# EasyEDA Pro project dev_box1.eprj

# Schematic Schematic1
Board Name: main; Create Date: 2026-04-28; Page Name: P1; Project Name: dev box1; Schematic Name: Schematic1; Update Date: 2026-06-05; Company: EasyEDA.com; Page Size: A4; Version: V1.0
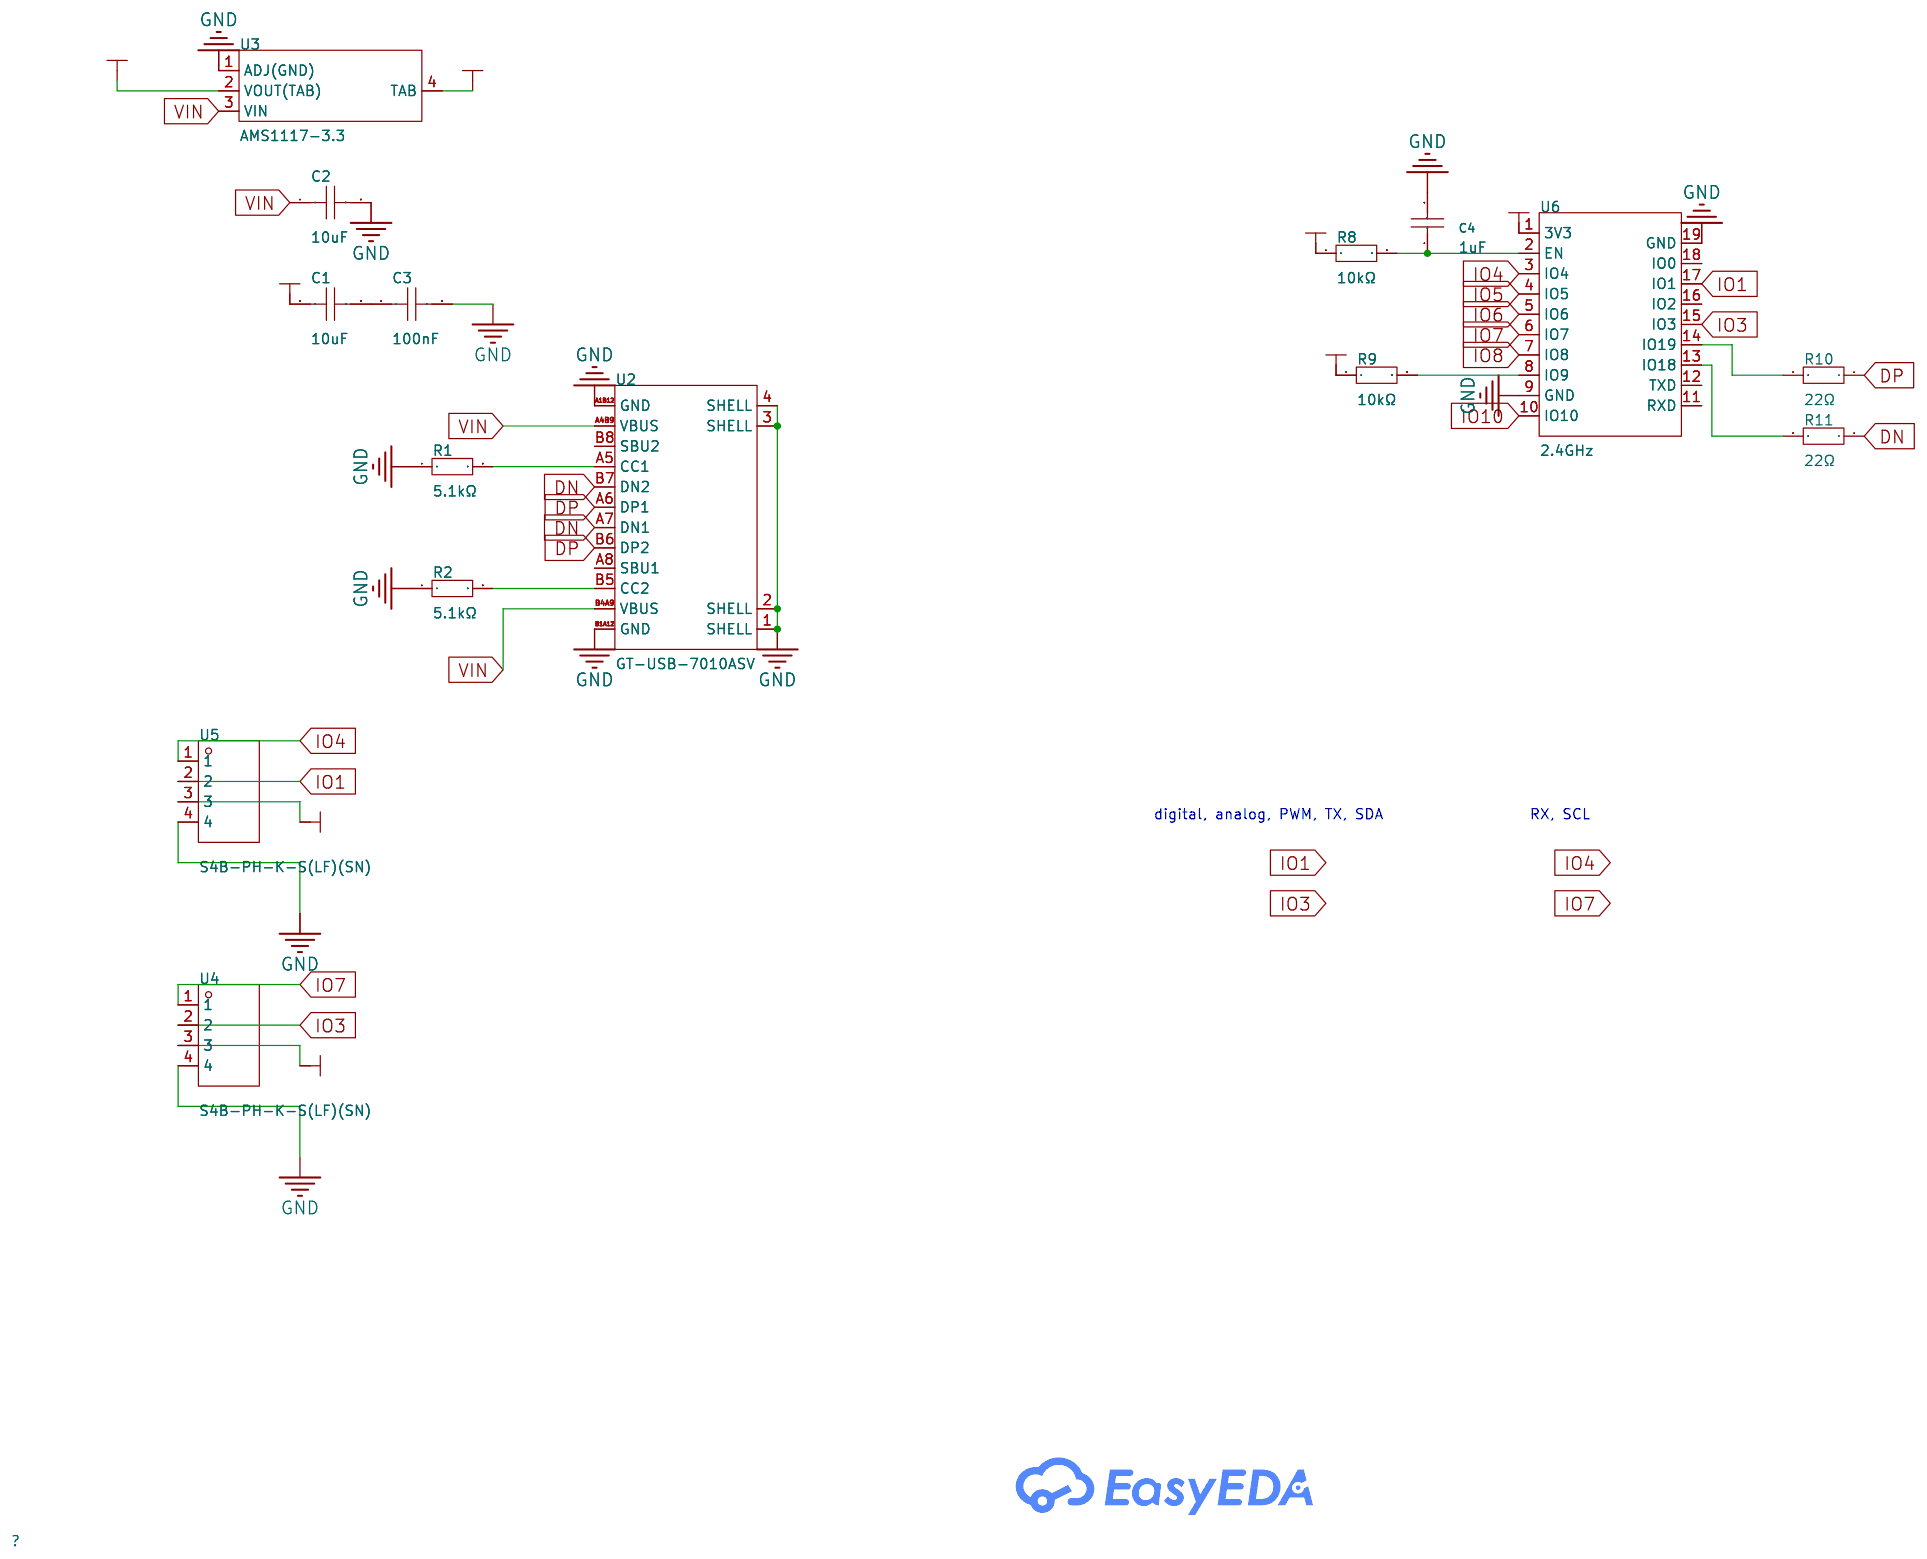
[diagram p0: schematic sheet]

## Parts
C1  10uF  [C0603]
C2  10uF  [C0603]
C3  100nF  [C0603]
C4  1uF  [C0603]
R1  5.1kΩ  [R0603]
R2  5.1kΩ  [R0603]
R8  10kΩ  [R0603]
R9  10kΩ  [R0603]
R10  22Ω  [R0603]
R11  22Ω  [R0603]
U2  GT-USB-7010ASV  [USB-C-SMD_G-SWITCH_GT-USB-7010ASV]
U3  AMS1117-3.3  [SOT-223-4_L6.5-W3.5-P2.30-LS7.0-BR]
U4  S4B-PH-K-S(LF)(SN)  [CONN-TH_4P-P2.00_S4B-PH-K-S-LF-SN]
U5  S4B-PH-K-S(LF)(SN)  [CONN-TH_4P-P2.00_S4B-PH-K-S-LF-SN]
U6  2.4GHz  [WIFIM-SMD_18P-L20.0-W18.0-P1.50]

## Library data of the parts
C1 C2 = CC0603MRX5R8BB106: LCSC Part Name: 10uF ±20% 25V; Supplier Part: C596327; Manufacturer: YAGEO(国巨); Supplier Footprint: 0603; JLCPCB Part Class: Extended Part; Datasheet: https://item.szlcsc.com/datasheet/CC0603MRX5R8BB106/624311.html; Supplier: LCSC; Tolerance: ±20%; Voltage Rating: 25V; Temperature Coefficient: X5R
C3 = CC0603KRX7R9BB104: LCSC Part Name: 100nF ±10% 50V; Supplier Part: C14663; Manufacturer: YAGEO(国巨); Supplier Footprint: 0603; JLCPCB Part Class: Basic Part; Datasheet: https://item.szlcsc.com/datasheet/CC0603KRX7R9BB104/15331.html; Supplier: LCSC; Tolerance: ±10%; Voltage Rating: 50V; Temperature Coefficient: X7R
C4 = CC0603KRX7R7BB105: LCSC Part Name: 1uF ±10% 16V; Supplier Part: C106248; Manufacturer: YAGEO(国巨); Supplier Footprint: 0603; JLCPCB Part Class: Extended Part; Datasheet: https://item.szlcsc.com/datasheet/CC0603KRX7R7BB105/107463.html; Supplier: LCSC; Tolerance: ±10%; Voltage Rating: 16V; Temperature Coefficient: X7R
R1 R2 = RT0603BRD075K1L: LCSC Part Name: 薄膜电阻 5.1kΩ ±0.1% 100mW; Supplier Part: C122969; Manufacturer: YAGEO(国巨); Supplier Footprint: 0603; JLCPCB Part Class: Extended Part; Datasheet: https://atta.szlcsc.com/upload/public/pdf/source/20170728/C122969_1501225761505848820.pdf; Supplier: LCSC; Type: Thin Film Resistor; Tolerance: ±0.1%; Temperature Coefficient: ±25ppm/℃; Operating Temperature Range: -55℃~+155℃
R8 R9 = RC0603FR-0710KL: LCSC Part Name: 厚膜电阻 10kΩ ±1% 100mW; Supplier Part: C98220; Manufacturer: YAGEO(国巨); Supplier Footprint: 0603; JLCPCB Part Class: Extended Part; Datasheet: https://atta.szlcsc.com/upload/public/pdf/source/20180927/C295883_E8D83085EA81BD7DE0B2B681138C15EE.pdf; Supplier: LCSC; Type: Thick Film Resistors; Tolerance: ±1%; Temperature Coefficient: ±100ppm/℃; Operating Temperature Range: -55℃~+155℃
R10 R11 = RC0603FR-0722RL: LCSC Part Name: 厚膜电阻 22Ω ±1% 100mW; Supplier Part: C107701; Manufacturer: YAGEO(国巨); Supplier Footprint: 0603; JLCPCB Part Class: Extended Part; Datasheet: https://atta.szlcsc.com/upload/public/pdf/source/20170914/C127450_1505359406912967677.pdf; Supplier: LCSC; Type: Thick Film Resistors; Tolerance: ±1%; Temperature Coefficient: ±100ppm/℃; Operating Temperature Range: -55℃~+155℃
U2 = GT-USB-7010ASV: LCSC Part Name: Type-C 母 卧贴; Supplier Part: C2988369; Manufacturer: G-Switch(品赞); Supplier Footprint: SMD; JLCPCB Part Class: Extended Part; Datasheet: https://item.szlcsc.com/datasheet/GT-USB-7010ASV/3445595.html; Supplier: LCSC; Connector Type: Type-C; Protocol Standard: USB 2.0; Gender: Female; Mounting Type: Surface Mount, Right Angle; Number of Contacts: 16P; Number of Ports: 1; Current Rating-Power: 3A; Voltage Rating: 24V; Connect-Disconnect Life: 10,000 cycles; Center Height: 1.68mm; Length: 7.35mm; Detection color: Black; Operating Temperature: -40℃~+85℃
U3 = AMS1117-3.3_C347222: LCSC Part Name: 3.3V 1A 12V; Supplier Part: C347222; Manufacturer: UMW(友台半导体); Supplier Footprint: SOT-223; JLCPCB Part Class: Extended Part; Datasheet: https://item.szlcsc.com/datasheet/AMS1117-3.3/323882.html; Supplier: LCSC; Output Type: Fixed; Voltage - Supply: 12V; Output Voltage: 3.3V; Output Current: 1A; Power Supply Rejection Ratio (PSRR): 60dB@(120Hz); Voltage Dropout: 1.3V@(1A); standby current: 5mA; Noise: 0.003%Vout; Features: Over Current Protection; Operating Temperature: -40℃~+125℃; Output Configuration: Positive; Number of Outputs: 1
U4 U5 = S4B-PH-K-S(LF)(SN): LCSC Part Name: 1x4P 间距:2mm 弯插 系列:PH; Supplier Part: C157926; Manufacturer: JST; Supplier Footprint: 弯插,P=2mm; JLCPCB Part Class: Extended Part; Datasheet: https://item.szlcsc.com/datasheet/S4B-PH-K-S(LF)(SN)/169274.html; Supplier: LCSC; Pins Structure: 1x4P; Pitch: 2mm; Mounting Type: Right Angle; Reference Series: PH; Number of Pins: 4P; Number of Rows: 1; Number of PINs Per Row: 4; Current Rating: 2A; Contact Material: Brass; Contact Plating: Tin; Operating Temperature: -25℃~+85℃; Voltage Rating: 100V; Plastic Material: PA66; Flame Retardant Rating: UL94V-0; Supplementary Features: K Pin; Color: White; Z-Height of the Board: 4.8mm; X-Length of Bottom Edge on Board (Spacing Line): 9.9mm; Y-Width of Bottom Edge on Board: 7.6mm
U6 = ESP32-C3-WROOM-02-H4: LCSC Part Name: 不带固件 2.4GHz Wi-Fi（802.11b/g/n）+ 蓝牙5模组; Supplier Part: C2944070; Manufacturer: ESPRESSIF(乐鑫); Supplier Footprint: SMD,20x18mm; JLCPCB Part Class: Extended Part; Datasheet: https://item.szlcsc.com/datasheet/ESP32-C3-WROOM-02-H4/3329762.html; Supplier: LCSC; Utilized IC / Part: ESP32-C3; Wireless Standard: Bluetooth5.0; Interface Type: I2C；UART；SPI；USB；I2S; Antenna Type: On-board PCB Antenna; Output Power: 20.5dBm; Voltage - Supply: 3V~3.6V; Receive  Current: 82mA; Send  Current: 345mA; Sensitivity: -105dBm; Operating Temperature: -40℃~+105℃

## Nets
3.3V: C1.1 R8.1 R9.1 U3.2(VOUT(TAB)) U3.4(TAB) U4.3 U5.3 U6.1(3V3)
GND: C2.2 C3.2 C4.2 R1.1 R2.1 U2.1(SHELL) U2.2(SHELL) U2.3(SHELL) U2.4(SHELL) U2.A1B12(GND) U2.B1A12(GND) U3.1(ADJ(GND)) U4.4 U5.4 U6.9(GND) U6.19(GND)
VIN: C2.1 U2.A4B9(VBUS) U2.B4A9(VBUS) U3.3(VIN)
DN: R11.1 U2.A7(DN1) U2.B7(DN2)
DP: R10.1 U2.A6(DP1) U2.B6(DP2)
IO1: U5.2 U6.17(IO1)
IO3: U4.2 U6.15(IO3)
IO4: U5.1 U6.3(IO4)
IO5: U6.4(IO5)
IO6: U6.5(IO6)
IO7: U4.1 U6.6(IO7)
IO8: U6.7(IO8)
IO10: U6.10(IO10)
$1N2133: R1.2 U2.A5(CC1)
$1N2135: R2.2 U2.B5(CC2)
$1N2463: C1.2 C3.1
$1N6447: R10.2 U6.14(IO19)
$1N6453: R11.2 U6.13(IO18)
$1N6705: C4.1 R8.2 U6.2(EN)
$1N6831: R9.2 U6.8(IO9)

Not connected (* = marked no-connect by the designer): U2 A8(SBU1) B8(SBU2); U6 11(RXD) 12(TXD) 16(IO2) 18(IO0)

## Notes on the sheet
- digital, analog, PWM, TX, SDA
- RX, SCL

# Schematic Schematic2
Board Name: temp&hum; Create Date: 2026-04-29; Page Name: P1; Project Name: dev box1; Schematic Name: Schematic2; Update Date: 2026-04-29; Company: EasyEDA.com; Page Size: A4; Version: V1.0
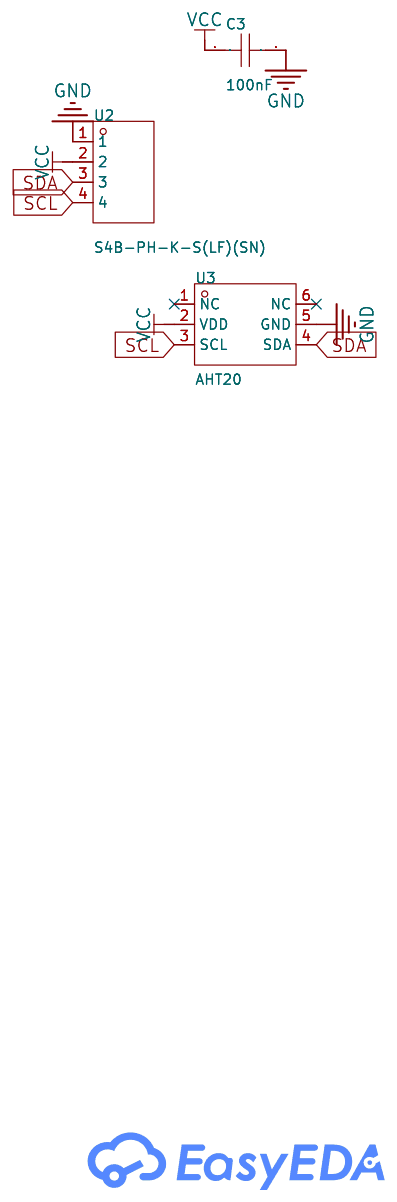
[diagram p1: schematic sheet]

## Parts
C3  100nF  [C0603]
U2  S4B-PH-K-S(LF)(SN)  [CONN-TH_4P-P2.00_S4B-PH-K-S-LF-SN]
U3  AHT20  [SENSOR-SMD_L3.0-W3.0-P1.00-BR]

## Library data of the parts
C3 = CC0603KRX7R9BB104: LCSC Part Name: 100nF ±10% 50V; Supplier Part: C14663; Manufacturer: YAGEO(国巨); Supplier Footprint: 0603; JLCPCB Part Class: Basic Part; Datasheet: https://item.szlcsc.com/datasheet/CC0603KRX7R9BB104/15331.html; Supplier: LCSC; Tolerance: ±10%; Voltage Rating: 50V; Temperature Coefficient: X7R
U2 = S4B-PH-K-S(LF)(SN): LCSC Part Name: 1x4P 间距:2mm 弯插 系列:PH; Supplier Part: C157926; Manufacturer: JST; Supplier Footprint: 弯插,P=2mm; JLCPCB Part Class: Extended Part; Datasheet: https://item.szlcsc.com/datasheet/S4B-PH-K-S(LF)(SN)/169274.html; Supplier: LCSC; Pins Structure: 1x4P; Pitch: 2mm; Mounting Type: Right Angle; Reference Series: PH; Number of Pins: 4P; Number of Rows: 1; Number of PINs Per Row: 4; Current Rating: 2A; Contact Material: Brass; Contact Plating: Tin; Operating Temperature: -25℃~+85℃; Voltage Rating: 100V; Plastic Material: PA66; Flame Retardant Rating: UL94V-0; Supplementary Features: K Pin; Color: White; Z-Height of the Board: 4.8mm; X-Length of Bottom Edge on Board (Spacing Line): 9.9mm; Y-Width of Bottom Edge on Board: 7.6mm
U3 = AHT20: LCSC Part Name: 温湿度传感器，完全标定，数字输出，IC接口; Supplier Part: C2757850; Manufacturer: 广州奥松; Supplier Footprint: SMD; JLCPCB Part Class: Extended Part; Datasheet: https://item.szlcsc.com/datasheet/AHT20/2874650.html; Supplier: LCSC; Temperature Range: -40℃~+120℃; Humidity: 0%RH~100%RH; Interface: I2C; Voltage - Supply: 2.2V~5.5V; Current - Supply: 570uA; Humidity Tolerance: ±2%RH; Temperature Tolerance: ±0.3℃; Resolution: 20bit

## Nets
GND: C3.2 U2.1 U3.5(GND)
VCC: C3.1 U2.2 U3.2(VDD)
SCL: U2.4 U3.3(SCL)
SDA: U2.3 U3.4(SDA)

Not connected (* = marked no-connect by the designer): U3 1(NC)* 6(NC)*

# Schematic Schematic2_1
Board Name: LED; Create Date: 2026-05-23; Page Name: P1; Project Name: dev box1; Schematic Name: Schematic2_1; Update Date: 2026-05-23; Company: EasyEDA.com; Page Size: A4; Version: V1.0
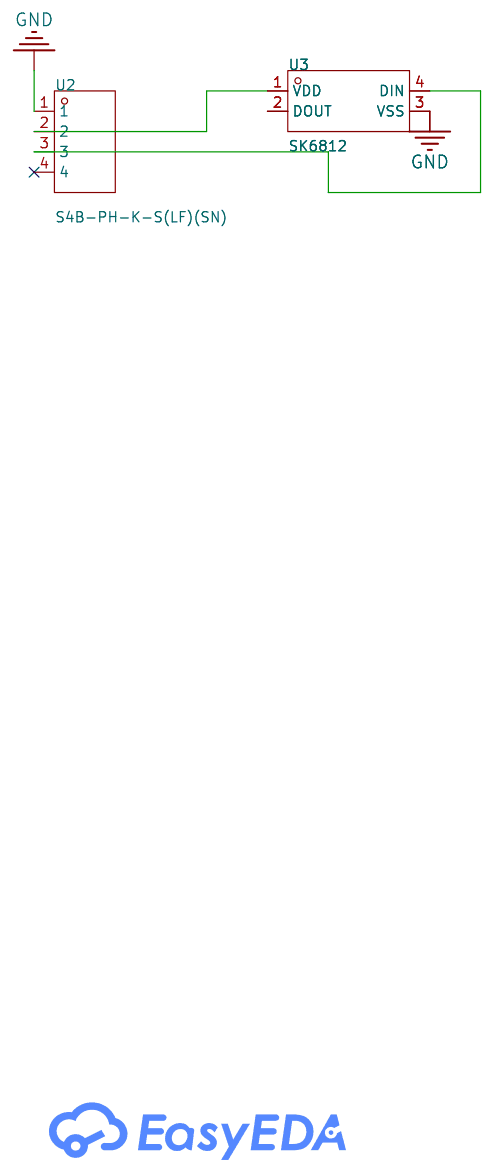
[diagram p2: schematic sheet]

## Parts
U2  S4B-PH-K-S(LF)(SN)  [CONN-TH_4P-P2.00_S4B-PH-K-S-LF-SN]
U3  SK6812  [LED-SMD_4P-L5.0-W5.0-TL]

## Library data of the parts
U2 = S4B-PH-K-S(LF)(SN): LCSC Part Name: 1x4P 间距:2mm 弯插 系列:PH; Supplier Part: C157926; Manufacturer: JST; Supplier Footprint: 弯插,P=2mm; JLCPCB Part Class: Extended Part; Datasheet: https://item.szlcsc.com/datasheet/S4B-PH-K-S(LF)(SN)/169274.html; Supplier: LCSC; Pins Structure: 1x4P; Pitch: 2mm; Mounting Type: Right Angle; Reference Series: PH; Number of Pins: 4P; Number of Rows: 1; Number of PINs Per Row: 4; Current Rating: 2A; Contact Material: Brass; Contact Plating: Tin; Operating Temperature: -25℃~+85℃; Voltage Rating: 100V; Plastic Material: PA66; Flame Retardant Rating: UL94V-0; Supplementary Features: K Pin; Color: White; Z-Height of the Board: 4.8mm; X-Length of Bottom Edge on Board (Spacing Line): 9.9mm; Y-Width of Bottom Edge on Board: 7.6mm
U3 = SK6812: Supplier Part: C2765348; Supplier Footprint: SMD-4P,2.0x4; Supplier: LCSC

## Nets
GND: U2.1 U3.3(VSS)
$1N1284: U2.2 U3.1(VDD)
$1N1293: U2.3 U3.4(DIN)

Not connected (* = marked no-connect by the designer): U2 4*; U3 2(DOUT)

# Schematic Schematic2_2
Board Name: BUZZER; Create Date: 2026-05-23; Page Name: P1; Project Name: dev box1; Schematic Name: Schematic2_2; Update Date: 2026-05-23; Company: EasyEDA.com; Page Size: A4; Version: V1.0
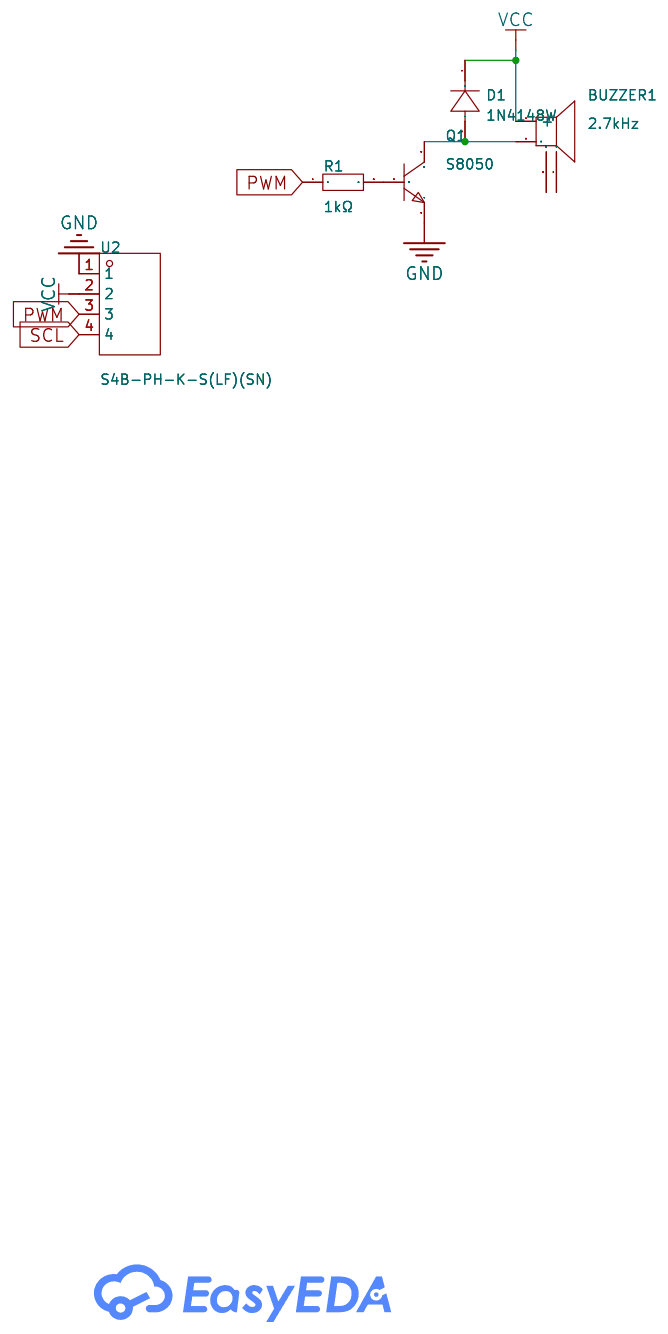
[diagram p3: schematic sheet]

## Parts
BUZZER1  2.7kHz  [BUZ-SMD_4P-L8.5-W8.5-P8.50-BR]
D1  1N4148W  [SOD-123_L2.8-W1.8-LS3.7-RD-1]
Q1  S8050  [SOT-23-3_L2.9-W1.3-P1.90-LS2.4-BR]
R1  1kΩ  [R0603]
U2  S4B-PH-K-S(LF)(SN)  [CONN-TH_4P-P2.00_S4B-PH-K-S-LF-SN]

## Library data of the parts
BUZZER1 = MLT-8530: LCSC Part Name: 无源(外部驱动) 电磁式 2.7kHz; Supplier Part: C94599; Manufacturer: 华能; Supplier Footprint: SMD,8.5x8.5mm; JLCPCB Part Class: Extended Part; Datasheet: https://item.szlcsc.com/datasheet/MLT-8530/95797.html; Supplier: LCSC; Driver Circuitry: Passive (Externally Driven); Technology: Electromagnetic; Voltage Rating: 3.6V; Voltage - Supply: 2.5V~4.5V; Current Consumption: 95mA; Sound Pressure Level(SPL): 80dB; Length: 8.5mm; Width: 8.5mm; Height: 3.3mm; Operating Temperature: -20℃~+70℃; Mounting Type: SMD
D1 = 1N4148W_C917030: Supplier Part: C917030; Manufacturer: JSMSEMI(杰盛微); Supplier Footprint: SOD-123; JLCPCB Part Class: Extended Part; Datasheet: https://item.szlcsc.com/datasheet/1N4148W/991526.html; Supplier: LCSC; Diode Configuration: Independent; Voltage - Forward(Vf@If): 1.25V@150mA; Voltage - DC Reverse(Vr): 100V; Current - Rectified: 300mA; Pd - Power Dissipation: 400mW; Reverse Leakage Current (Ir): 1uA@75V; Reverse Recovery Time (trr): 8ns; Operating Junction Temperature Range: -55℃~+150℃@(Tj); Non-Repetitive Peak Forward Surge Current: 4A
Q1 = S8050_C916390: LCSC Part Name: 电流:500mA 电压:25V; Supplier Part: C916390; Manufacturer: JSMSEMI(杰盛微); Supplier Footprint: SOT-23; JLCPCB Part Class: Extended Part; Datasheet: https://item.szlcsc.com/datasheet/S8050/990886.html; Supplier: LCSC; Current - Collector(Ic): 500mA; Collector - Emitter Voltage VCEO: 25V; Pd - Power Dissipation: 300mW; Transition frequency(fT): 150MHz; Current - Collector Cutoff: 100nA; Vce Saturation(VCE(sat)): 600mV; Emitter-Base Voltage(Vebo): 5V; Number: 1 NPN; Configuration: Independent
R1 = RC0603FR-071KL: LCSC Part Name: 厚膜电阻 1kΩ ±1% 100mW; Supplier Part: C22548; Manufacturer: YAGEO(国巨); Supplier Footprint: 0603; JLCPCB Part Class: Extended Part; Datasheet: https://item.szlcsc.com/datasheet/RC0603FR-071KL/23274.html; Supplier: LCSC; Type: Thick Film Resistor; Tolerance: ±1%; Power(Watts): 100mW; Voltage-Supply(Max): 75V; Temperature Coefficient: ±100ppm/℃; Operating Temperature: -55℃~+155℃
U2 = S4B-PH-K-S(LF)(SN): LCSC Part Name: 1x4P 间距:2mm 弯插 系列:PH; Supplier Part: C157926; Manufacturer: JST; Supplier Footprint: 弯插,P=2mm; JLCPCB Part Class: Extended Part; Datasheet: https://item.szlcsc.com/datasheet/S4B-PH-K-S(LF)(SN)/169274.html; Supplier: LCSC; Pins Structure: 1x4P; Pitch: 2mm; Mounting Type: Right Angle; Reference Series: PH; Number of Pins: 4P; Number of Rows: 1; Number of PINs Per Row: 4; Current Rating: 2A; Contact Material: Brass; Contact Plating: Tin; Operating Temperature: -25℃~+85℃; Voltage Rating: 100V; Plastic Material: PA66; Flame Retardant Rating: UL94V-0; Supplementary Features: K Pin; Color: White; Z-Height of the Board: 4.8mm; X-Length of Bottom Edge on Board (Spacing Line): 9.9mm; Y-Width of Bottom Edge on Board: 7.6mm

## Nets
GND: Q1.2(E) U2.1
VCC: BUZZER1.1(+) D1.1(C) U2.2
PWM: R1.1 U2.3
SCL: U2.4
$1N1566: Q1.1(B) R1.2
$1N1608: BUZZER1.2 D1.2(A) Q1.3(C)

Not connected (* = marked no-connect by the designer): BUZZER1 3 4

# Schematic Schematic2_3
Board Name: gyro&acce; Create Date: 2026-05-24; Page Name: P1; Project Name: dev box1; Schematic Name: Schematic2_3; Update Date: 2026-05-24; Company: EasyEDA.com; Page Size: A4; Version: V1.0
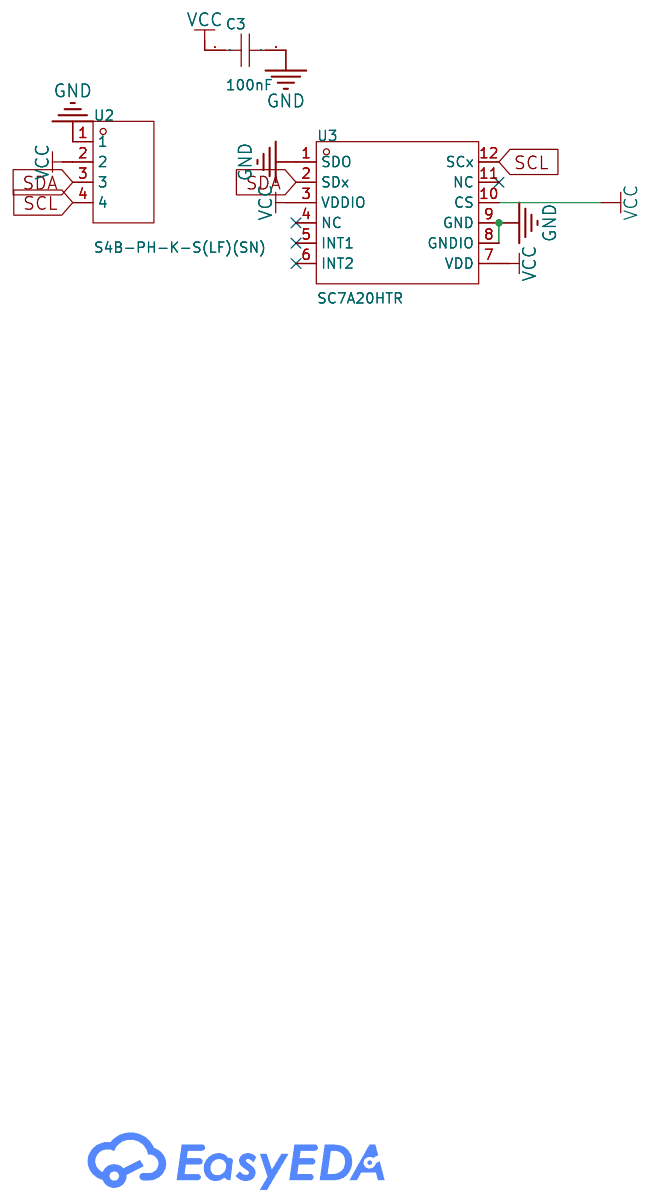
[diagram p4: schematic sheet]

## Parts
C3  100nF  [C0603]
U2  S4B-PH-K-S(LF)(SN)  [CONN-TH_4P-P2.00_S4B-PH-K-S-LF-SN]
U3  SC7A20HTR  [LGA-12_L2.0-W2.0-P0.50-TL]

## Library data of the parts
C3 = CC0603KRX7R9BB104: LCSC Part Name: 100nF ±10% 50V; Supplier Part: C14663; Manufacturer: YAGEO(国巨); Supplier Footprint: 0603; JLCPCB Part Class: Basic Part; Datasheet: https://item.szlcsc.com/datasheet/CC0603KRX7R9BB104/15331.html; Supplier: LCSC; Tolerance: ±10%; Voltage Rating: 50V; Temperature Coefficient: X7R
U2 = S4B-PH-K-S(LF)(SN): LCSC Part Name: 1x4P 间距:2mm 弯插 系列:PH; Supplier Part: C157926; Manufacturer: JST; Supplier Footprint: 弯插,P=2mm; JLCPCB Part Class: Extended Part; Datasheet: https://item.szlcsc.com/datasheet/S4B-PH-K-S(LF)(SN)/169274.html; Supplier: LCSC; Pins Structure: 1x4P; Pitch: 2mm; Mounting Type: Right Angle; Reference Series: PH; Number of Pins: 4P; Number of Rows: 1; Number of PINs Per Row: 4; Current Rating: 2A; Contact Material: Brass; Contact Plating: Tin; Operating Temperature: -25℃~+85℃; Voltage Rating: 100V; Plastic Material: PA66; Flame Retardant Rating: UL94V-0; Supplementary Features: K Pin; Color: White; Z-Height of the Board: 4.8mm; X-Length of Bottom Edge on Board (Spacing Line): 9.9mm; Y-Width of Bottom Edge on Board: 7.6mm
U3 = SC7A20HTR: LCSC Part Name: ±2G/±4G/±8G/±16G三轴微机械数字加速度计; Supplier Part: C19274408; Manufacturer: SILAN(士兰微); Supplier Footprint: LGA-12(2x2); JLCPCB Part Class: Extended Part; Datasheet: https://item.szlcsc.com/datasheet/SC7A20HTR/20603496.html; Supplier: LCSC; Accelerometer Sensing Axis: X,Y,Z; Acceleration Measurement Range (MAX): ±16g; Sensor Type: Accelerometer; Output Bits: 12bit; Interface: I2C；SPI; Voltage - Supply: 1.71V~3.6V; Standby Current: 500nA; Operating Temperature: -40℃~+85℃

## Nets
GND: C3.2 U2.1 U3.1(SDO) U3.8(GNDIO) U3.9(GND)
VCC: C3.1 U2.2 U3.3(VDDIO) U3.7(VDD) U3.10(CS)
SCL: U2.4 U3.12(SCx)
SDA: U2.3 U3.2(SDx)

Not connected (* = marked no-connect by the designer): U3 4(NC)* 5(INT1)* 6(INT2)* 11(NC)*

# Schematic Schematic2_4
Board Name: temp&hum; Create Date: 2026-04-29; Page Name: P1; Project Name: dev box1; Schematic Name: Schematic2; Update Date: 2026-04-29; Company: EasyEDA.com; Page Size: A4; Version: V1.0
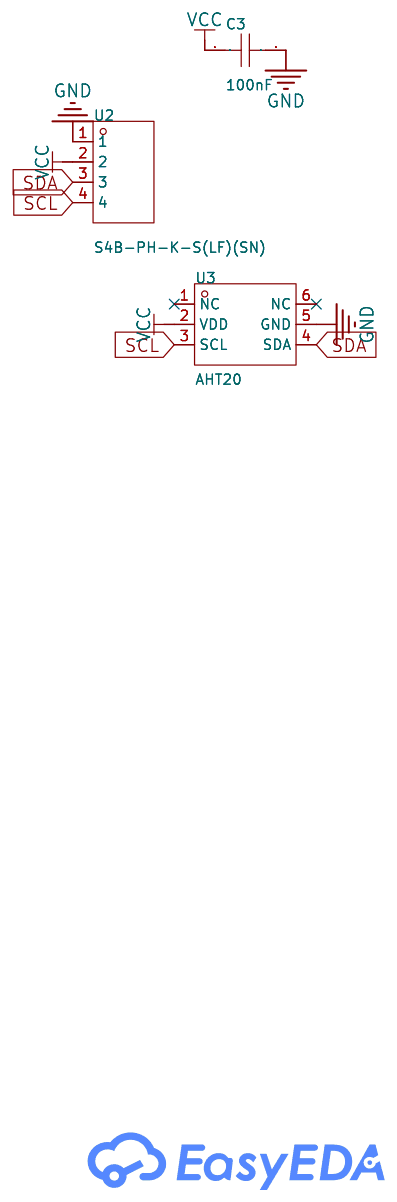
[diagram p5: schematic sheet]

## Parts
C3  100nF  [C0603]
U2  S4B-PH-K-S(LF)(SN)  [CONN-TH_4P-P2.00_S4B-PH-K-S-LF-SN]
U3  AHT20  [SENSOR-SMD_L3.0-W3.0-P1.00-BR]

## Library data of the parts
C3 = CC0603KRX7R9BB104: LCSC Part Name: 100nF ±10% 50V; Supplier Part: C14663; Manufacturer: YAGEO(国巨); Supplier Footprint: 0603; JLCPCB Part Class: Basic Part; Datasheet: https://item.szlcsc.com/datasheet/CC0603KRX7R9BB104/15331.html; Supplier: LCSC; Tolerance: ±10%; Voltage Rating: 50V; Temperature Coefficient: X7R
U2 = S4B-PH-K-S(LF)(SN): LCSC Part Name: 1x4P 间距:2mm 弯插 系列:PH; Supplier Part: C157926; Manufacturer: JST; Supplier Footprint: 弯插,P=2mm; JLCPCB Part Class: Extended Part; Datasheet: https://item.szlcsc.com/datasheet/S4B-PH-K-S(LF)(SN)/169274.html; Supplier: LCSC; Pins Structure: 1x4P; Pitch: 2mm; Mounting Type: Right Angle; Reference Series: PH; Number of Pins: 4P; Number of Rows: 1; Number of PINs Per Row: 4; Current Rating: 2A; Contact Material: Brass; Contact Plating: Tin; Operating Temperature: -25℃~+85℃; Voltage Rating: 100V; Plastic Material: PA66; Flame Retardant Rating: UL94V-0; Supplementary Features: K Pin; Color: White; Z-Height of the Board: 4.8mm; X-Length of Bottom Edge on Board (Spacing Line): 9.9mm; Y-Width of Bottom Edge on Board: 7.6mm
U3 = AHT20: LCSC Part Name: 温湿度传感器，完全标定，数字输出，IC接口; Supplier Part: C2757850; Manufacturer: 广州奥松; Supplier Footprint: SMD; JLCPCB Part Class: Extended Part; Datasheet: https://item.szlcsc.com/datasheet/AHT20/2874650.html; Supplier: LCSC; Temperature Range: -40℃~+120℃; Humidity: 0%RH~100%RH; Interface: I2C; Voltage - Supply: 2.2V~5.5V; Current - Supply: 570uA; Humidity Tolerance: ±2%RH; Temperature Tolerance: ±0.3℃; Resolution: 20bit

## Nets
GND: C3.2 U2.1 U3.5(GND)
VCC: C3.1 U2.2 U3.2(VDD)
SCL: U2.4 U3.3(SCL)
SDA: U2.3 U3.4(SDA)

Not connected (* = marked no-connect by the designer): U3 1(NC)* 6(NC)*

# Schematic Schematic1_1
Board Name: main_rp2040; Create Date: 2026-07-12; Page Name: P1; Project Name: dev box1; Schematic Name: Schematic1_1; Update Date: 2026-07-14; Company: EasyEDA.com; Page Size: A4; Version: V1.0
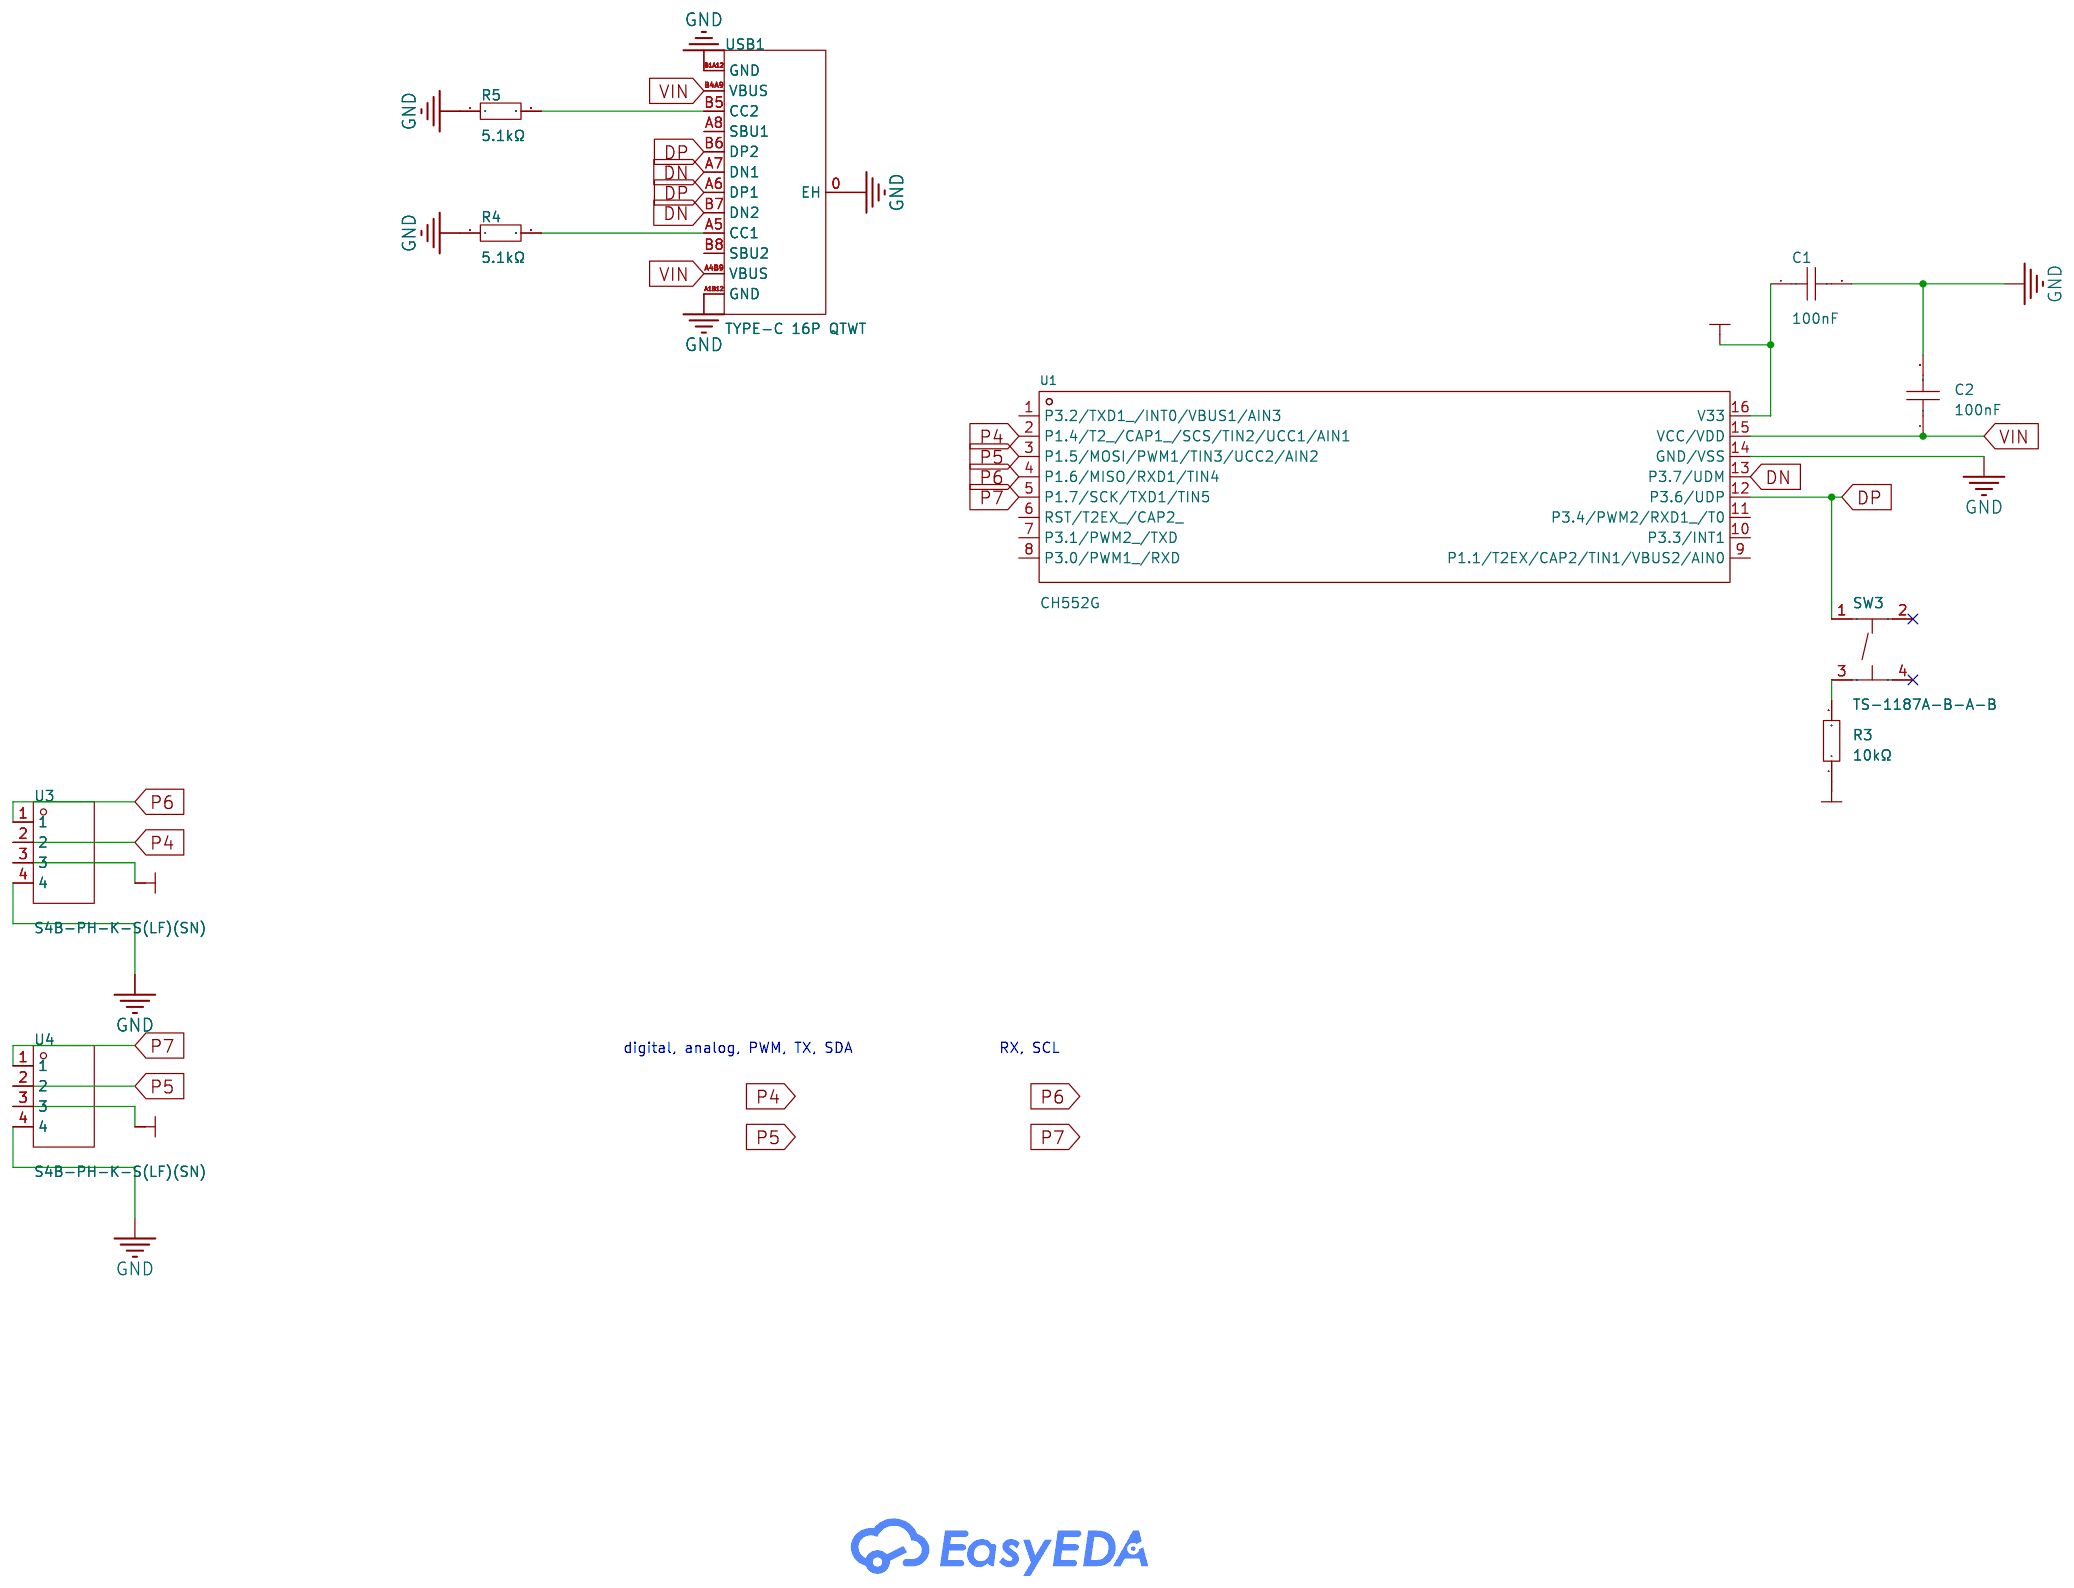
[diagram p6: schematic sheet]

## Parts
C1  100nF  [C0603]
C2  100nF  [C0603]
R3  10kΩ  [R0603]
R4  5.1kΩ  [R0603]
R5  5.1kΩ  [R0603]
SW3  TS-1187A-B-A-B  [SW-SMD_4P-L5.1-W5.1-P3.70-LS6.5-TL_H1.5]
U1  CH552G  [SOP-16_L10.0-W3.9-P1.27-LS6.0-BL]
U3  S4B-PH-K-S(LF)(SN)  [CONN-TH_4P-P2.00_S4B-PH-K-S-LF-SN]
U4  S4B-PH-K-S(LF)(SN)  [CONN-TH_4P-P2.00_S4B-PH-K-S-LF-SN]
USB1  TYPE-C 16P QTWT  [USB-TYPE-C-SMD_TYPE-C-16P-QTWT]

## Library data of the parts
C1 C2 = CC0603KRX7R9BB104: LCSC Part Name: 100nF ±10% 50V; Supplier Part: C14663; Manufacturer: YAGEO(国巨); Supplier Footprint: 0603; JLCPCB Part Class: Basic Part; Datasheet: https://item.szlcsc.com/datasheet/CC0603KRX7R9BB104/15331.html; Supplier: LCSC; Tolerance: ±10%; Voltage Rating: 50V; Temperature Coefficient: X7R
R3 = RC0603FR-0710KL: LCSC Part Name: 厚膜电阻 10kΩ ±1% 100mW; Supplier Part: C98220; Manufacturer: YAGEO(国巨); Supplier Footprint: 0603; JLCPCB Part Class: Extended Part; Datasheet: https://atta.szlcsc.com/upload/public/pdf/source/20180927/C295883_E8D83085EA81BD7DE0B2B681138C15EE.pdf; Supplier: LCSC; Type: Thick Film Resistors; Tolerance: ±1%; Temperature Coefficient: ±100ppm/℃; Operating Temperature Range: -55℃~+155℃
R4 R5 = RT0603BRD075K1L: LCSC Part Name: 薄膜电阻 5.1kΩ ±0.1% 100mW; Supplier Part: C122969; Manufacturer: YAGEO(国巨); Supplier Footprint: 0603; JLCPCB Part Class: Extended Part; Datasheet: https://atta.szlcsc.com/upload/public/pdf/source/20170728/C122969_1501225761505848820.pdf; Supplier: LCSC; Type: Thin Film Resistor; Tolerance: ±0.1%; Temperature Coefficient: ±25ppm/℃; Operating Temperature Range: -55℃~+155℃
SW3 = TS-1187A-B-A-B: LCSC Part Name: 5.1*5.1*1.5mm 立贴 轻触开关; Supplier Part: C318884; Manufacturer: XKB Connection(中国星坤); Supplier Footprint: SMD; Datasheet: https://item.szlcsc.com/datasheet/TS-1187A-B-A-B/299976.html; Supplier: LCSC; Circuit: SPST; Actuator Style: Round Button; Operating Force: 1.6N; Mounting Type: Surface Mount,Vertical; Length: 5.1mm; Width: 5.1mm; Switch Height: 1.5mm; with Bracket: Without Bracket; Contact Current: 50mA; Voltage Rating: 12V; Actuator/Cap Color: Gold; With Lamp: No; Life: 100,000 Cycles; Operating Temperature: -30℃~+85℃
U1 = CH552G: LCSC Part Name: 8位增强型USB单片机; Supplier Part: C111292; Manufacturer: WCH(南京沁恒); Supplier Footprint: SOP-16; Datasheet: https://item.szlcsc.com/datasheet/CH552G/112518.html; Supplier: LCSC; CPU Core: 51 Series; CPU Maximum Speed: 24MHz; Program Storage Size: 16KB; Program Memory Type: FLASH; ADC (Bit): 8bit; PWM (Bit): 8bit; Voltage - Supply: 3.3V~5V
U3 U4 = S4B-PH-K-S(LF)(SN): LCSC Part Name: 1x4P 间距:2mm 弯插 系列:PH; Supplier Part: C157926; Manufacturer: JST; Supplier Footprint: 弯插,P=2mm; JLCPCB Part Class: Extended Part; Datasheet: https://item.szlcsc.com/datasheet/S4B-PH-K-S(LF)(SN)/169274.html; Supplier: LCSC; Pins Structure: 1x4P; Pitch: 2mm; Mounting Type: Right Angle; Reference Series: PH; Number of Pins: 4P; Number of Rows: 1; Number of PINs Per Row: 4; Current Rating: 2A; Contact Material: Brass; Contact Plating: Tin; Operating Temperature: -25℃~+85℃; Voltage Rating: 100V; Plastic Material: PA66; Flame Retardant Rating: UL94V-0; Supplementary Features: K Pin; Color: White; Z-Height of the Board: 4.8mm; X-Length of Bottom Edge on Board (Spacing Line): 9.9mm; Y-Width of Bottom Edge on Board: 7.6mm
USB1 = TYPE-C 16P QTWT: LCSC Part Name: 16P卧贴母座; Supplier Part: C5187472; Manufacturer: SHOU HAN(首韩); Supplier Footprint: SMD; JLCPCB Part Class: Extended Part; Datasheet: https://item.szlcsc.com/datasheet/TYPE-C%252016P%2520QTWT/5860367.html; Supplier: LCSC; Connector Type: Type-C; Gender: Female; Mounting Type: Surface Mount, Right Angle; Number of Contacts: 16P; Number of Ports: 1; Current Rating-Power: 3A; Voltage Rating: 5V; Connect-Disconnect Life: 5,000 cycles; Detection color: Black; Operating Temperature: -25℃~+85℃

## Nets
3.3V: C1.1 R3.1 U1.16(V33) U3.3 U4.3
GND: C1.2 C2.2 R4.1 R5.1 U1.14(GND/VSS) U3.4 U4.4 USB1.0(EH) USB1.A1B12(GND) USB1.B1A12(GND)
VIN: C2.1 U1.15(VCC/VDD) USB1.A4B9(VBUS) USB1.B4A9(VBUS)
DN: U1.13(P3.7/UDM) USB1.A7(DN1) USB1.B7(DN2)
DP: SW3.1(A) U1.12(P3.6/UDP) USB1.A6(DP1) USB1.B6(DP2)
P4: U1.2(P1.4/T2_/CAP1_/SCS/TIN2/UCC1/AIN1) U3.2
P5: U1.3(P1.5/MOSI/PWM1/TIN3/UCC2/AIN2) U4.2
P6: U1.4(P1.6/MISO/RXD1/TIN4) U3.1
P7: U1.5(P1.7/SCK/TXD1/TIN5) U4.1
$1N9782: R3.2 SW3.3(C)
Net-(R4-2): R4.2 USB1.A5(CC1)
Net-(R5-2): R5.2 USB1.B5(CC2)

Not connected (* = marked no-connect by the designer): SW3 2(B)* 4(D)*; U1 1(P3.2/TXD1_/INT0/VBUS1/AIN3) 6(RST/T2EX_/CAP2_) 7(P3.1/PWM2_/TXD) 8(P3.0/PWM1_/RXD) 9(P1.1/T2EX/CAP2/TIN1/VBUS2/AIN0) 10(P3.3/INT1) 11(P3.4/PWM2/RXD1_/T0); USB1 A8(SBU1) B8(SBU2)

## Notes on the sheet
- digital, analog, PWM, TX, SDA
- RX, SCL

# Schematic Schematic3
Board Name: button; Create Date: 2026-08-07; Page Name: P1; Project Name: dev box1; Schematic Name: Schematic3; Update Date: 2026-08-07; Company: EasyEDA.com; Page Size: A4; Version: V1.0
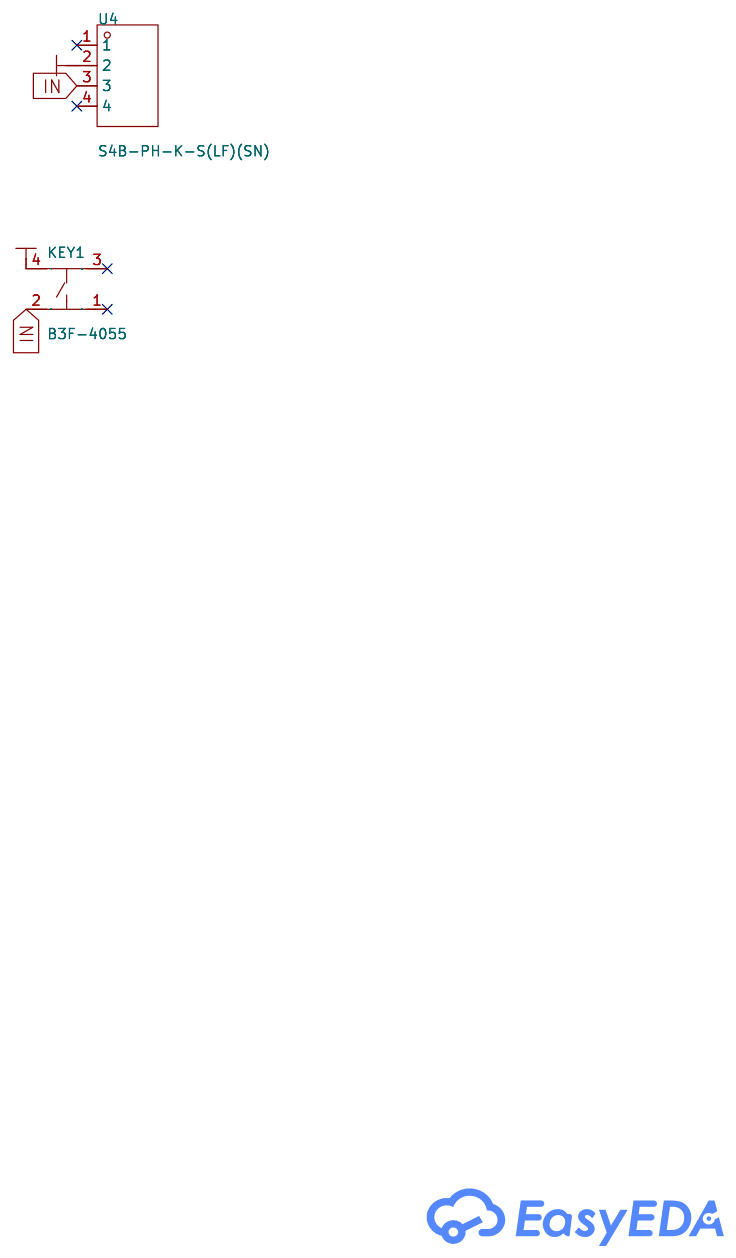
[diagram p7: schematic sheet]

## Parts
KEY1  B3F-4055  [KEY-TH_4P-L12.0-W12.0-P5.00-LS13.4-EH]
U4  S4B-PH-K-S(LF)(SN)  [CONN-TH_4P-P2.00_S4B-PH-K-S-LF-SN]

## Library data of the parts
KEY1 = B3F-4055_C84931: LCSC Part Name: 12*12*7.3mm 直插 轻触开关; Supplier Part: C84931; Manufacturer: OMRON(欧姆龙); Supplier Footprint: 插件-4P,12x12mm; Datasheet: https://item.szlcsc.com/datasheet/B3F-4055/86103.html; Supplier: LCSC; Circuit: SPST; Actuator Style: Rectangular Button; Mounting Type: Through Hole; Length: 12mm; Width: 12mm; Switch Height: 7.3mm; Contact Current: 50mA; Voltage Rating: 24V
U4 = S4B-PH-K-S(LF)(SN): LCSC Part Name: 1x4P 间距:2mm 弯插 系列:PH; Supplier Part: C157926; Manufacturer: JST; Supplier Footprint: 弯插,P=2mm; JLCPCB Part Class: Extended Part; Datasheet: https://item.szlcsc.com/datasheet/S4B-PH-K-S(LF)(SN)/169274.html; Supplier: LCSC; Pins Structure: 1x4P; Pitch: 2mm; Mounting Type: Right Angle; Reference Series: PH; Number of Pins: 4P; Number of Rows: 1; Number of PINs Per Row: 4; Current Rating: 2A; Contact Material: Brass; Contact Plating: Tin; Operating Temperature: -25℃~+85℃; Voltage Rating: 100V; Plastic Material: PA66; Flame Retardant Rating: UL94V-0; Supplementary Features: K Pin; Color: White; Z-Height of the Board: 4.8mm; X-Length of Bottom Edge on Board (Spacing Line): 9.9mm; Y-Width of Bottom Edge on Board: 7.6mm

## Nets
3.3V: KEY1.4 U4.2
IN: KEY1.2 U4.3

Not connected (* = marked no-connect by the designer): KEY1 1* 3*; U4 1* 4*

# Board PCB2
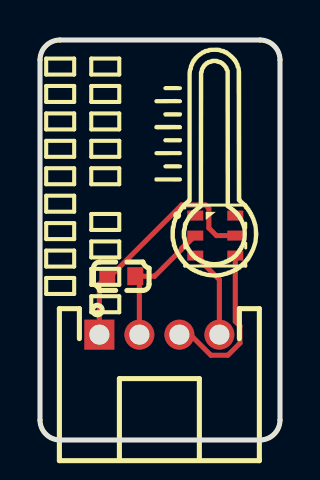
[diagram p8: board, top side]
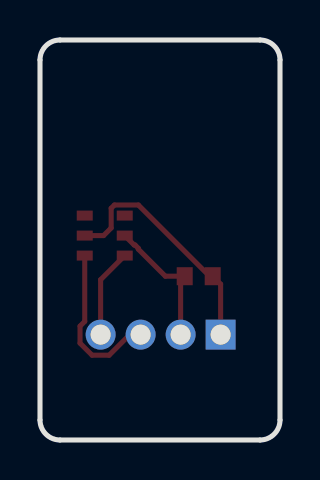
[diagram p9: board, bottom side, seen from below]

Outline 12 x 20 mm; copper layers: Top Layer, Bottom Layer. Coordinates in mm from the lower left corner of the outline.
Outline path: 0,19 0,1 arc(0.29,0.29) 1,0 11,0 arc(11.71,0.29) 12,1 12,19 arc(11.71,19.71) 11,20 1,20 arc(0.29,19.71) 0,19
Stack: Top Layer 0.035mm / Dielectric1 1.51mm FR4 er 4.5 / Bottom Layer 0.035mm

## Design rules (mm)
template: JLCPCB Capability(Two Layers Board)
spacing copperThickness1oz (default): track to track 0.102, other pairs 0.152 to 0.3
spacing copperThickness2oz: track to track 0.203, other pairs 0.152 to 0.3
track width copperThickness1oz (default): min 0.127, default 0.254, max 2.54
track width copperThickness2oz: min 0.203, default 0.254, max 2.54
differential pair differentialPair (default): width min 0.127, default 0.254, max 2.54; gap min 0.152, default 0.152
via viaSize (default): diameter min 0.5, default 0.61, max 10; hole min 0.3, default 0.305, max 6.3

## Placement (name value [footprint] x y rotation side)
C3  100nF  [C0603]  4.06 8.19 180 top
U2  S4B-PH-K-S(LF)(SN)  [CONN-TH_4P-P2.00_S4B-PH-K-S-LF-SN]  5.97 5.27 0 top
U3  AHT20  [SENSOR-SMD_L3.0-W3.0-P1.00-BR]  8.76 10.22 180 top

## Footprints (pads in the part's own frame, mm; a bottom-side part is the same pattern mirrored in y, then rotated)
C0603
  rect 0.8x0.9 smd: 1(-0.7,0) 2(0.7,0)
CONN-TH_4P-P2.00_S4B-PH-K-S-LF-SN
  rect 1.5x1.5 hole 1: 1(-3,0)
  round 1.5 hole 1: 2(-1,0) 3(1,0) 4(3,0)
SENSOR-SMD_L3.0-W3.0-P1.00-BR
  rect 0.8x0.5 smd: 1(1,-1) 2(1,0) 3(1,1) 4(-1,1) 5(-1,0) 6(-1,-1)

## Nets
As in the schematic.

Pads without a net: U3 1 6

## Routing (per net, layer and track width the routed paths; a pad name or vN(x,y) marks a point on that pad's centre or on a via; arc(x,y) is an arc through that point)
GND: length 12.2
  Top Layer w0.254: U3.5 8.82,10.22 8.44,10.6 8.44,11.59 8.28,11.75 7.08,11.75 3.52,8.19 C3.2 2.97,7.79 U2.1
VCC: length 6.9
  Top Layer w0.254: U3.2 7.29,9.75 7.25,9.75 7.08,9.59 7.08,9.54 5.73,8.19 C3.1 4.97,7.98 U2.2
SCL: length 4.5
  Top Layer w0.254: U3.3 8.97,8.02 U2.4
SDA: length 8.2
  Top Layer w0.254: U3.4 9.76,5.93 10,5.69 10,4.84 9.4,4.24 8.54,4.24 7.51,5.27 U2.3

## Text on the board
Top Silkscreen Layer: חיישן לחות / וטמפרטורה

# Board PCB3
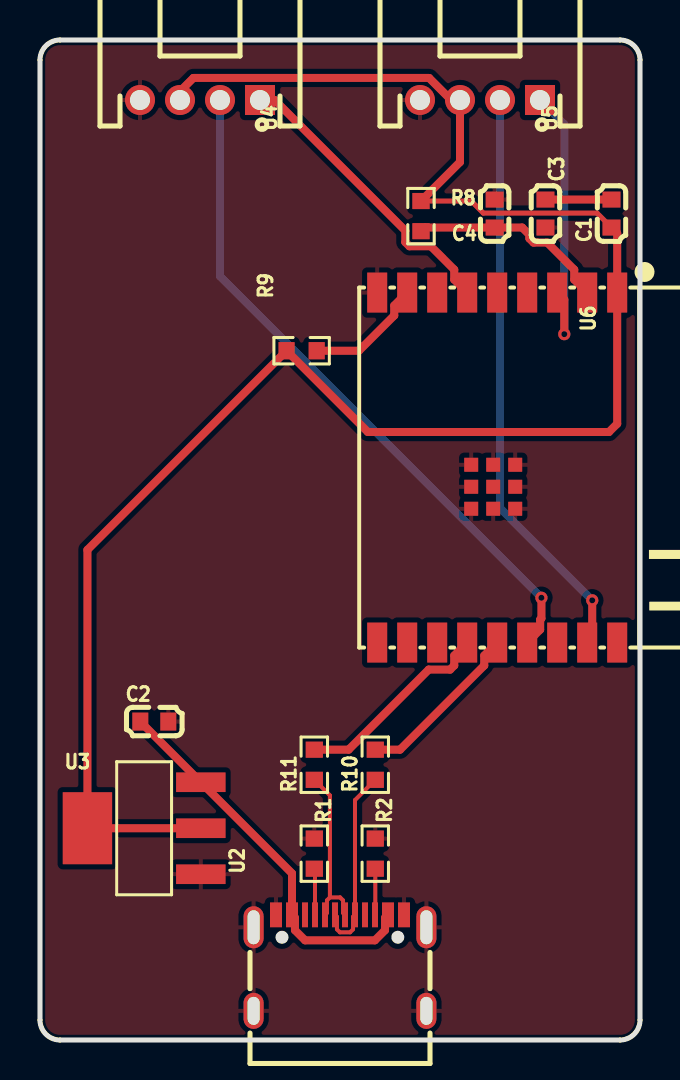
[diagram p10: board, top side]
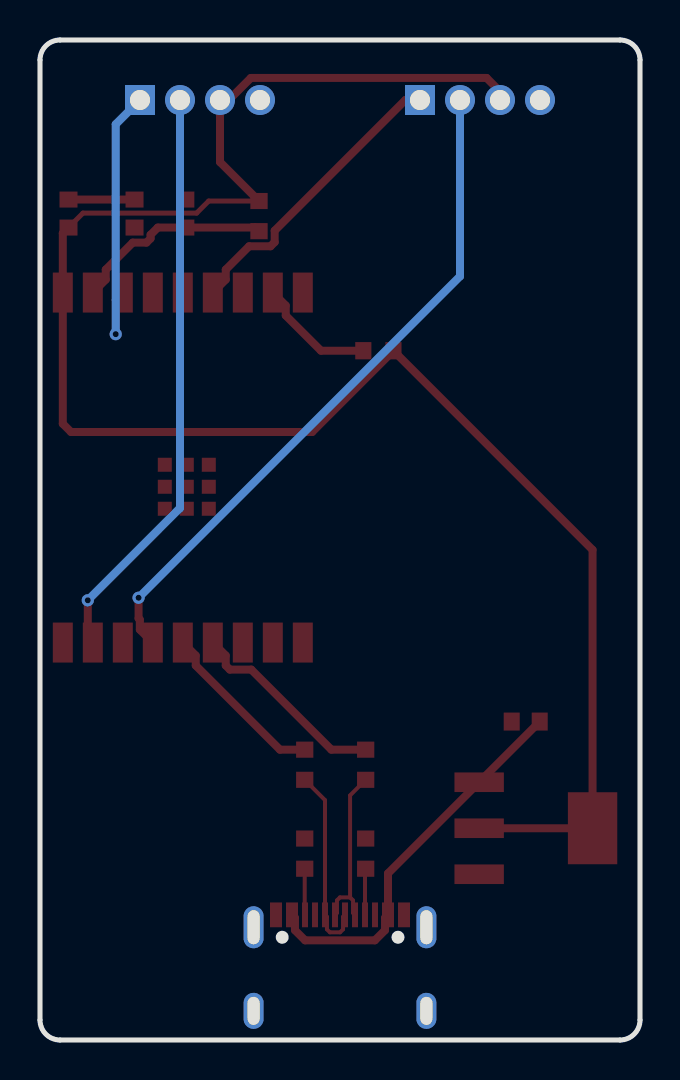
[diagram p11: board, bottom side, seen from below]

Outline 30 x 50 mm; copper layers: Top Layer, Bottom Layer. Coordinates in mm from the lower left corner of the outline.
Outline path: 0,49 0,1 arc(0.29,0.29) 1,0 29,0 arc(29.71,0.29) 30,1 30,49 arc(29.71,49.71) 29,50 1,50 arc(0.29,49.71) 0,49
Stack: Top Layer 0.035mm / Dielectric1 1.51mm FR4 er 4.5 / Bottom Layer 0.035mm

## Design rules (mm)
template: JLCPCB Capability(Two Layers Board)
spacing copperThickness1oz (default): track to track 0.102, other pairs 0.152 to 0.3
spacing copperThickness2oz: track to track 0.203, other pairs 0.152 to 0.3
track width copperThickness1oz (default): min 0.127, default 0.254, max 2.54
track width copperThickness2oz: min 0.203, default 0.254, max 2.54
differential pair differentialPair (default): width min 0.127, default 0.254, max 2.54; gap min 0.152, default 0.152
via viaSize (default): diameter min 0.5, default 0.61, max 10; hole min 0.3, default 0.305, max 6.3

## Placement (name value [footprint] x y rotation side)
C1  10uF  [C0603]  28.57 41.32 90 top
C2  10uF  [C0603]  5.72 15.92 0 top
C3  100nF  [C0603]  25.27 41.32 270 top
C4  1uF  [C0603]  22.73 41.32 90 top
R1  5.1kΩ  [R0603]  13.72 9.32 270 top
R2  5.1kΩ  [R0603]  16.76 9.32 270 top
R8  10kΩ  [R0603]  19.05 41.19 270 top
R9  10kΩ  [R0603]  13.08 34.46 0 top
R10  22Ω  [R0603]  16.76 13.76 90 top
R11  22Ω  [R0603]  13.72 13.76 90 top
U2  GT-USB-7010ASV  [USB-C-SMD_G-SWITCH_GT-USB-7010ASV]  15 3.86 0 top
U3  AMS1117-3.3  [SOT-223-4_L6.5-W3.5-P2.30-LS7.0-BR]  5.21 10.59 0 top
U4  S4B-PH-K-S(LF)(SN)  [CONN-TH_4P-P2.00_S4B-PH-K-S-LF-SN]  8 47 180 top
U5  S4B-PH-K-S(LF)(SN)  [CONN-TH_4P-P2.00_S4B-PH-K-S-LF-SN]  22 47 180 top
U6  2.4GHz  [WIFIM-SMD_18P-L20.0-W18.0-P1.50]  22.86 28.62 270 top

## Footprints (pads in the part's own frame, mm; a bottom-side part is the same pattern mirrored in y, then rotated)
C0603
  rect 0.8x0.9 smd: 1(-0.7,0) 2(0.7,0)
CONN-TH_4P-P2.00_S4B-PH-K-S-LF-SN
  rect 1.5x1.5 hole 1: 1(-3,0)
  round 1.5 hole 1: 2(-1,0) 3(1,0) 4(3,0)
R0603
  rect 0.806x0.864 smd: 1(-0.753,0) 2(0.753,0)
SOT-223-4_L6.5-W3.5-P2.30-LS7.0-BR
  rect 2.47x0.98 smd: 1(2.835,-2.3) 2(2.835,0) 3(2.835,2.3)
  rect 2.47x3.6 smd: 4(-2.835,0)
USB-C-SMD_G-SWITCH_GT-USB-7010ASV
  oval 1x2.1 hole 0.6x1.7: 1(-4.32,1.78) 2(4.32,1.78)
  oval 1x1.8 hole 0.6x1.4: 3(4.32,-2.4) 4(-4.32,-2.4)
  rect 0.6x1.24 smd: A1B12(-3.2,2.4) A4B9(-2.4,2.4) B1A12(3.2,2.4) B4A9(2.4,2.4)
  rect 0.3x1.24 smd: A5(-1.25,2.4) A6(-0.25,2.4) A7(0.25,2.4) A8(1.25,2.4) B5(1.75,2.4) B6(0.75,2.4) B7(-0.75,2.4) B8(-1.75,2.4)
WIFIM-SMD_18P-L20.0-W18.0-P1.50
  rect 2x1 smd: 1(-8.75,6) 2(-8.75,4.5) 3(-8.75,3) 4(-8.75,1.5) 5(-8.75,0) 6(-8.75,-1.5) 7(-8.75,-3) 8(-8.75,-4.5) 9(-8.75,-6) 10(8.75,-6) 11(8.75,-4.5) 12(8.75,-3) 13(8.75,-1.5) 14(8.75,0) 15(8.75,1.5) 16(8.75,3) 17(8.75,4.5) 18(8.75,6)
  rect 0.7x0.7 smd: 19(-0.14,0.9) 19(-0.14,-0.2) 19(-0.14,-1.3) 19(0.96,0.9) 19(0.96,-0.2) 19(0.96,-1.3) 19(2.06,0.9) 19(2.06,-0.2) 19(2.06,-1.3)

## Nets
As in the schematic.

Pads without a net: U2 A8 B8; U6 11 12 16 18

## Via types
v1: diameter 0.61, hole 0.305, Top Layer to Bottom Layer, 3 vias

## Routing (per net, layer and track width the routed paths; a pad name or vN(x,y) marks a point on that pad's centre or on a via; arc(x,y) is an arc through that point)
3.3V: length 93.1
  Top Layer w0.25: R8.1 21.56,41.95 22.17,41.34 27.85,41.34 C1.1
  Top Layer w0.4: U4.3 7,47.43 7.67,48.1 19.46,48.1 20.56,47 U5.3 21,43.9 R8.1 ; U3.2 U3.4 2.37,24.51 R9.1 16.39,30.4 28.45,30.4 28.86,30.81 U6.1 28.86,40.34 C1.1
VIN: length 19.4
  Top Layer w0.4: U2.B4A9 17.25,6.11 17.25,5.49 16.74,4.98 13.26,4.98 12.75,5.49 12.75,6.11 U2.A4B9 12.6,8.33 U3.3 5.01,15.92 C2.1
DN: length 8.7
  Top Layer w0.2: U2.B7 14.35,6.35 14.35,6.98 14.5,7.13 ; U2.A7 15.15,6.35 15.15,6.98 15,7.13 14.5,7.13 ; 14.5,7.13 14.5,12.23 R11.1
DP: length 9.6
  Top Layer w0.2: R10.1 15.75,12 U2.B6 15.65,6.16 15.65,5.53 15.5,5.38 15,5.38 14.85,5.53 14.85,6.16 U2.A6
IO1: length 29.1
  Top Layer w0.4: U6.17 27.61,20.12 v1(27.61,21.98)
  Bottom Layer w0.4: v1(27.61,21.98) 23,26.6 U5.2
IO3: length 34.1
  Top Layer w0.4: v1(25.07,22.11) 25.07,21.08 25.01,21.02 25.01,20.52 U6.15
  Bottom Layer w0.4: v1(25.07,22.11) 9,38.18 U4.2
IO4: length 14.4
  Top Layer w0.4: v1(26.21,35.29) 26.21,37.02 U6.3
  Bottom Layer w0.4: U5.1 26.21,45.79 v1(26.21,35.29)
IO7: length 15
  Top Layer w0.4: U6.6 20.71,38.02 20.71,38.52 19.54,39.69 18.47,39.69 18.27,39.89 18.27,40.47 11.73,47 U4.1
$1N2133: length 2.3
  Top Layer w0.2: U2.A5 13.75,8.53 R1.2
$1N2135: length 2.3
  Top Layer w0.2: R2.2 16.76,6.27 U2.B5
$1N2463: length 3.3
  Top Layer w0.4: C1.2 C3.1
$1N6447: length 8.6
  Top Layer w0.4: R10.2 18,14.52 22.21,18.73 22.21,19.22 U6.14
$1N6453: length 10.2
  Top Layer w0.4: R11.2 15.43,14.52 19.43,18.52 20.51,18.52 20.71,18.73 20.71,19.22 U6.13
$1N6705: length 10.1
  Top Layer w0.4: R8.2 19.23,40.62 C4.1 24.11,40.62 24.47,40.26 24.47,40.08 24.68,39.87 25.36,39.87 26.71,38.52 26.71,38.02 U6.2
$1N6831: length 6
  Top Layer w0.4: R9.2 15.95,34.46 17.71,36.23 17.71,36.72 U6.8

## Copper pours and planes (outline as drawn; the poured copper is in the pictures)
GND on Top Layer: -4.57,55.17 37.85,55.17 37.85,-3.64 -4.57,-3.64

# Board PCB2_1
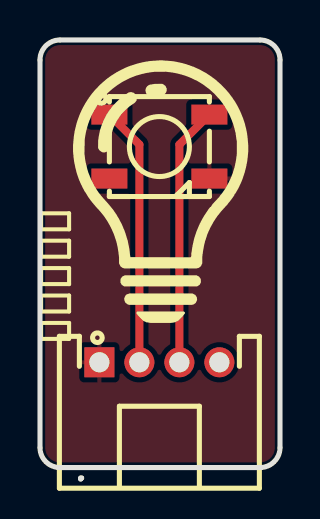
[diagram p12: board, top side]
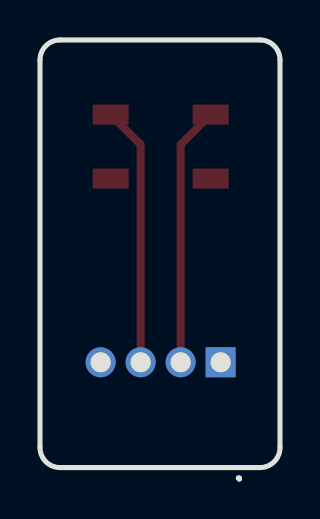
[diagram p13: board, bottom side, seen from below]

Outline 12 x 21.97 mm; copper layers: Top Layer, Bottom Layer. Coordinates in mm from the lower left corner of the outline.
Outline path: 0,20.97 0,1.57 arc(0.29,0.87) 1,0.57 11,0.57 arc(11.71,0.87) 12,1.57 12,20.97 arc(11.71,21.68) 11,21.97 1,21.97 arc(0.29,21.68) 0,20.97 ; 2.03,0.05 2.03,0 2.08,0.05 2.03,0.05
Stack: Top Layer 0.035mm / Dielectric1 1.51mm FR4 er 4.5 / Bottom Layer 0.035mm

## Design rules (mm)
template: JLCPCB Capability(Two Layers Board)
spacing copperThickness1oz (default): track to track 0.102, other pairs 0.152 to 0.3
spacing copperThickness2oz: track to track 0.203, other pairs 0.152 to 0.3
track width copperThickness1oz (default): min 0.127, default 0.254, max 2.54
track width copperThickness2oz: min 0.203, default 0.254, max 2.54
differential pair differentialPair (default): width min 0.127, default 0.254, max 2.54; gap min 0.152, default 0.152
via viaSize (default): diameter min 0.5, default 0.61, max 10; hole min 0.3, default 0.305, max 6.3

## Placement (name value [footprint] x y rotation side)
U2  S4B-PH-K-S(LF)(SN)  [CONN-TH_4P-P2.00_S4B-PH-K-S-LF-SN]  5.97 5.84 0 top
U3  SK6812  [LED-SMD_4P-L5.0-W5.0-TL]  5.97 16.64 0 top

## Footprints (pads in the part's own frame, mm; a bottom-side part is the same pattern mirrored in y, then rotated)
CONN-TH_4P-P2.00_S4B-PH-K-S-LF-SN
  rect 1.5x1.5 hole 1: 1(-3,0)
  round 1.5 hole 1: 2(-1,0) 3(1,0) 4(3,0)
LED-SMD_4P-L5.0-W5.0-TL
  rect 1.8x1 smd: 1(-2.5,1.6) 2(-2.5,-1.6) 3(2.5,-1.6) 4(2.5,1.6)

## Nets
As in the schematic.

Pads without a net: U2 4; U3 2

## Routing (per net, layer and track width the routed paths; a pad name or vN(x,y) marks a point on that pad's centre or on a via; arc(x,y) is an arc through that point)
$1N1284: length 13
  Top Layer w0.4: U2.2 4.97,16.74 U3.1
$1N1293: length 13
  Top Layer w0.4: U2.3 6.97,16.74 U3.4

## Copper pours and planes (outline as drawn; the poured copper is in the pictures)
GND on Top Layer: -4.19,23.62 13.97,23.62 13.97,-2.41 -4.19,-2.41

## Text on the board
Top Silkscreen Layer: מנורה

# Board PCB2_2
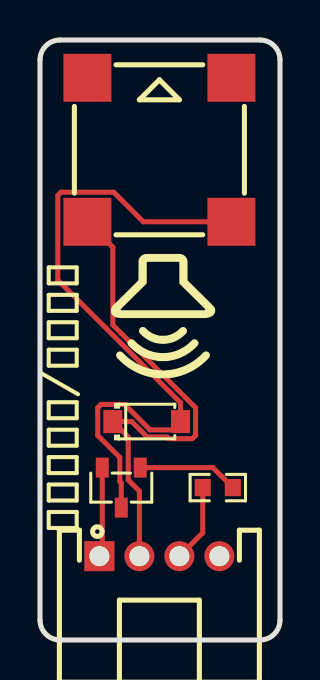
[diagram p14: board, top side]
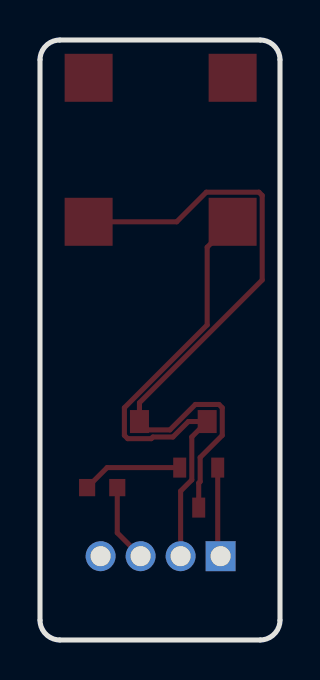
[diagram p15: board, bottom side, seen from below]

Outline 12 x 30 mm; copper layers: Top Layer, Bottom Layer. Coordinates in mm from the lower left corner of the outline.
Outline path: 0,29 0,1 arc(0.29,0.29) 1,0 11,0 arc(11.71,0.29) 12,1 12,29 arc(11.71,29.71) 11,30 1,30 arc(0.29,29.71) 0,29
Stack: Top Layer 0.035mm / Dielectric1 1.51mm FR4 er 4.5 / Bottom Layer 0.035mm

## Design rules (mm)
template: JLCPCB Capability(Two Layers Board)
spacing copperThickness1oz (default): track to track 0.102, other pairs 0.152 to 0.3
spacing copperThickness2oz: track to track 0.203, other pairs 0.152 to 0.3
track width copperThickness1oz (default): min 0.127, default 0.254, max 2.54
track width copperThickness2oz: min 0.203, default 0.254, max 2.54
differential pair differentialPair (default): width min 0.127, default 0.254, max 2.54; gap min 0.152, default 0.152
via viaSize (default): diameter min 0.5, default 0.61, max 10; hole min 0.3, default 0.305, max 6.3

## Placement (name value [footprint] x y rotation side)
BUZZER1  2.7kHz  [BUZ-SMD_4P-L8.5-W8.5-P8.50-BR]  5.97 24.51 0 top
D1  1N4148W  [SOD-123_L2.8-W1.8-LS3.7-RD-1]  5.33 10.92 0 top
Q1  S8050  [SOT-23-3_L2.9-W1.3-P1.90-LS2.4-BR]  4.06 7.62 90 top
R1  1kΩ  [R0603]  8.89 7.62 0 top
U2  S4B-PH-K-S(LF)(SN)  [CONN-TH_4P-P2.00_S4B-PH-K-S-LF-SN]  5.97 4.19 0 top

## Footprints (pads in the part's own frame, mm; a bottom-side part is the same pattern mirrored in y, then rotated)
BUZ-SMD_4P-L8.5-W8.5-P8.50-BR
  rect 2.4x2.4 smd: 1(-3.6,-3.6) 2(3.6,-3.6) 3(3.599,3.599) 4(-3.6,3.6)
CONN-TH_4P-P2.00_S4B-PH-K-S-LF-SN
  rect 1.5x1.5 hole 1: 1(-3,0)
  round 1.5 hole 1: 2(-1,0) 3(1,0) 4(3,0)
R0603
  rect 0.806x0.864 smd: 1(-0.753,0) 2(0.753,0)
SOD-123_L2.8-W1.8-LS3.7-RD-1
  rect 0.95x1.15 smd: 1(-1.692,0) 2(1.692,0)
SOT-23-3_L2.9-W1.3-P1.90-LS2.4-BR
  rect 1x0.65 smd: 1(1,-0.95) 2(1,0.95) 3(-1,0)

## Nets
As in the schematic.

Pads without a net: BUZZER1 3 4

## Routing (per net, layer and track width the routed paths; a pad name or vN(x,y) marks a point on that pad's centre or on a via; arc(x,y) is an arc through that point)
GND: length 4.5
  Top Layer w0.254: Q1.2 3.11,4.34 U2.1
VCC: length 24.8
  Top Layer w0.254: U2.2 4.97,7.45 4.41,8 4.41,10.15 D1.1 4.58,10.92 5.36,10.15 6.35,10.15 6.44,10.07 7.62,10.07 7.78,10.23 7.78,11.61 3.64,15.75 3.64,19.64 BUZZER1.1
PWM: length 3.9
  Top Layer w0.254: U2.3 8.14,5.36 R1.1
$1N1566: length 5
  Top Layer w0.254: R1.2 8.64,8.62 Q1.1
$1N1608: length 33.6
  Top Layer w0.254: Q1.3 4.06,7.85 3.99,7.92 3.99,9.13 2.89,10.23 2.89,11.61 3.05,11.78 4.23,11.78 5.5,10.5 6.61,10.5 D1.2 7.03,11.86 0.89,18 0.89,22.23 1.05,22.39 3.69,22.39 5.16,20.91 BUZZER1.2

## Text on the board
Top Silkscreen Layer: זמזם/רמקול
